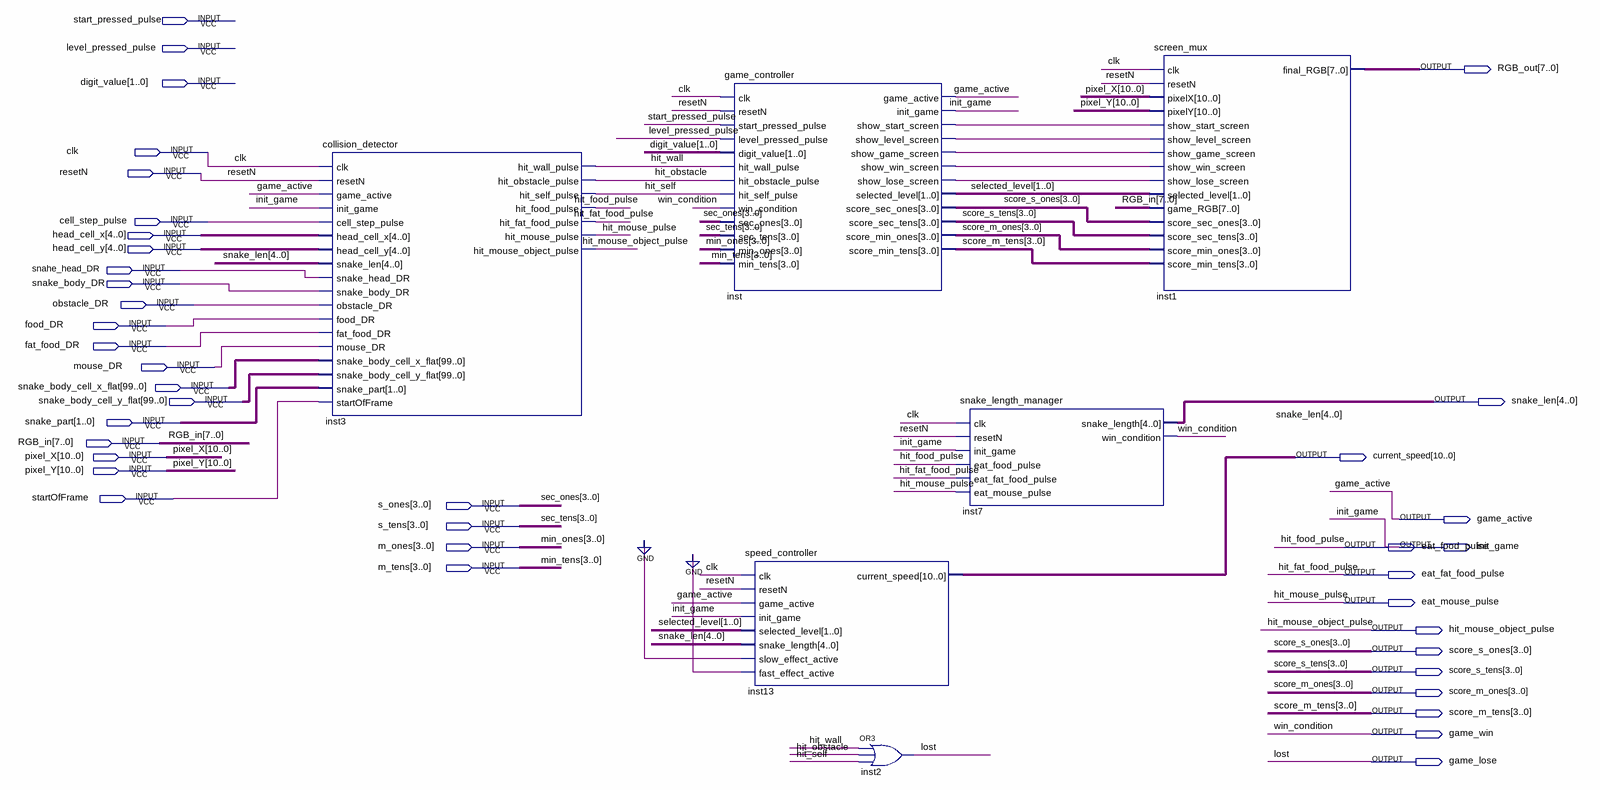
[diagram p0: schematic sheet]
// Quartus schematic Game_Control_T.bdf as structural Verilog: 6 symbols, 40 pins
module Game_Control_T (
  input  start_pressed_pulse,
  input  level_pressed_pulse,
  input  [1:0] digit_value,
  input  clk,
  input  resetN,
  input  cell_step_pulse,
  input  [4:0] head_cell_x,
  input  [4:0] head_cell_y,
  input  snahe_head_DR,
  input  snake_body_DR,
  input  obstacle_DR,
  input  food_DR,
  input  fat_food_DR,
  input  mouse_DR,
  input  [99:0] snake_body_cell_x_flat,
  input  [99:0] snake_body_cell_y_flat,
  input  [1:0] snake_part,
  input  [7:0] RGB_in,
  input  [10:0] pixel_X,
  input  [10:0] pixel_Y,
  input  startOfFrame,
  input  [3:0] s_ones,
  input  [3:0] s_tens,
  input  [3:0] m_ones,
  input  [3:0] m_tens,
  output [7:0] RGB_out,
  output [4:0] snake_len,
  output [10:0] current_speed,
  output game_active,
  output eat_food_pulse,
  output init_game,
  output eat_fat_food_pulse,
  output eat_mouse_pulse,
  output hit_mouse_object_pulse,
  output [3:0] score_s_ones,
  output [3:0] score_s_tens,
  output [3:0] score_m_ones,
  output [3:0] score_m_tens,
  output game_win,
  output game_lose
);

  wire hit_obstacle, hit_self, hit_wall, inst_show_game_screen, inst_show_level_screen,
       inst_show_lose_screen, inst_show_start_screen, inst_show_win_screen;
  wire [1:0] selected_level;

  collision_detector inst3 (
    .clk(clk), .resetN(resetN), .game_active(game_active), .init_game(init_game),
    .cell_step_pulse(cell_step_pulse), .head_cell_x(head_cell_x), .head_cell_y(head_cell_y),
    .snake_len(snake_len), .snake_head_DR(snahe_head_DR), .snake_body_DR(snake_body_DR),
    .obstacle_DR(obstacle_DR), .food_DR(food_DR), .fat_food_DR(fat_food_DR), .mouse_DR(mouse_DR),
    .snake_body_cell_x_flat(snake_body_cell_x_flat), .snake_body_cell_y_flat(snake_body_cell_y_flat),
    .snake_part(snake_part), .startOfFrame(startOfFrame), .hit_wall_pulse(hit_wall),
    .hit_obstacle_pulse(hit_obstacle), .hit_self_pulse(hit_self), .hit_food_pulse(eat_food_pulse),
    .hit_fat_food_pulse(eat_fat_food_pulse), .hit_mouse_pulse(eat_mouse_pulse),
    .hit_mouse_object_pulse(hit_mouse_object_pulse));
  game_controller inst (
    .clk(clk), .resetN(resetN), .start_pressed_pulse(start_pressed_pulse),
    .level_pressed_pulse(level_pressed_pulse), .digit_value(digit_value), .hit_wall_pulse(hit_wall),
    .hit_obstacle_pulse(hit_obstacle), .hit_self_pulse(hit_self), .win_condition(game_win),
    .sec_ones(s_ones), .sec_tens(s_tens), .min_ones(m_ones), .min_tens(m_tens), .game_active(game_active),
    .init_game(init_game), .show_start_screen(inst_show_start_screen),
    .show_level_screen(inst_show_level_screen), .show_game_screen(inst_show_game_screen),
    .show_win_screen(inst_show_win_screen), .show_lose_screen(inst_show_lose_screen),
    .selected_level(selected_level), .score_sec_ones(score_s_ones), .score_sec_tens(score_s_tens),
    .score_min_ones(score_m_ones), .score_min_tens(score_m_tens));
  speed_controller inst13 (
    .clk(clk), .resetN(resetN), .game_active(game_active), .init_game(init_game),
    .selected_level(selected_level), .snake_length(snake_len), .slow_effect_active(1'b0),
    .fast_effect_active(1'b0), .current_speed(current_speed));
  or inst2 (game_lose, hit_wall, hit_obstacle, hit_self);
  snake_length_manager inst7 (
    .clk(clk), .resetN(resetN), .init_game(init_game), .eat_food_pulse(eat_food_pulse),
    .eat_fat_food_pulse(eat_fat_food_pulse), .eat_mouse_pulse(eat_mouse_pulse), .snake_length(snake_len),
    .win_condition(game_win));
  screen_mux inst1 (
    .clk(clk), .resetN(resetN), .pixelX(pixel_X), .pixelY(pixel_Y),
    .show_start_screen(inst_show_start_screen), .show_level_screen(inst_show_level_screen),
    .show_game_screen(inst_show_game_screen), .show_win_screen(inst_show_win_screen),
    .show_lose_screen(inst_show_lose_screen), .selected_level(selected_level), .game_RGB(RGB_in),
    .score_sec_ones(score_s_ones), .score_sec_tens(score_s_tens), .score_min_ones(score_m_ones),
    .score_min_tens(score_m_tens), .final_RGB(RGB_out));

  // Other names for the same wires on the sheet: hit_fat_food_pulse = eat_fat_food_pulse;
  //   hit_food_pulse = eat_food_pulse; hit_mouse_pulse = eat_mouse_pulse; lost = game_lose; min_ones[3:0] = m_ones;
  //   min_tens[3:0] = m_tens; sec_ones[3:0] = s_ones; sec_tens[3:0] = s_tens; win_condition = game_win
endmodule
